# Altium schematic sheet PCB-MAIN_01_POWER.SchDoc
size 594 x 420 mm
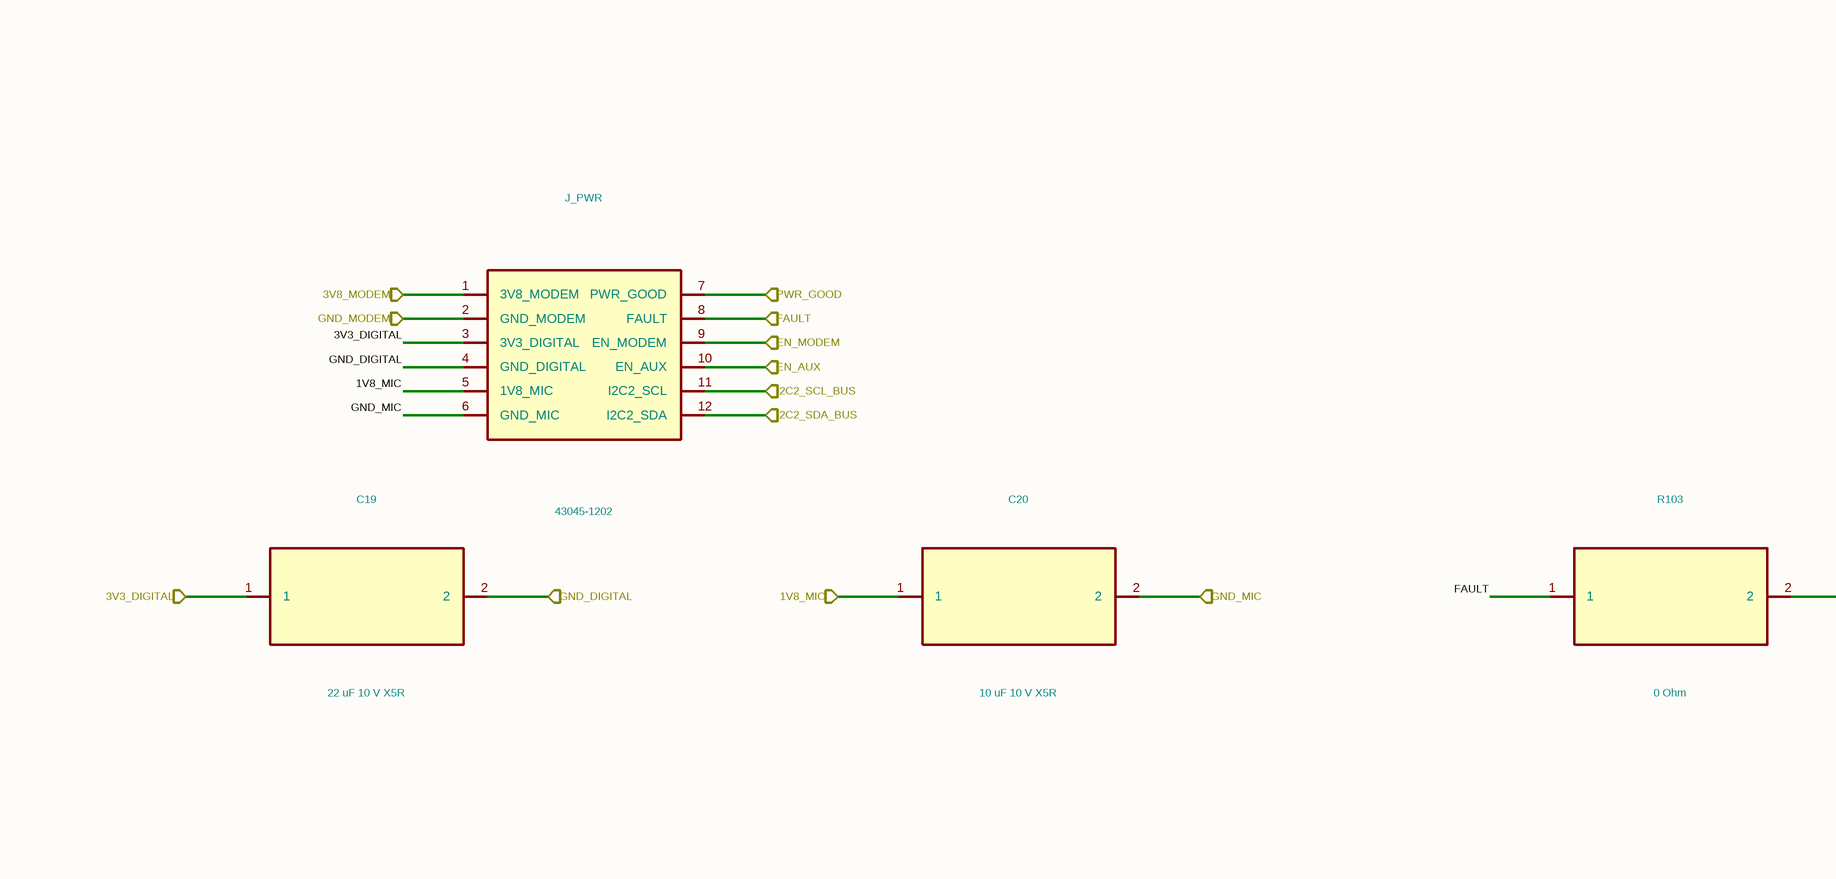
[diagram p0: PCB-MAIN_01_POWER.SchDoc, top left]
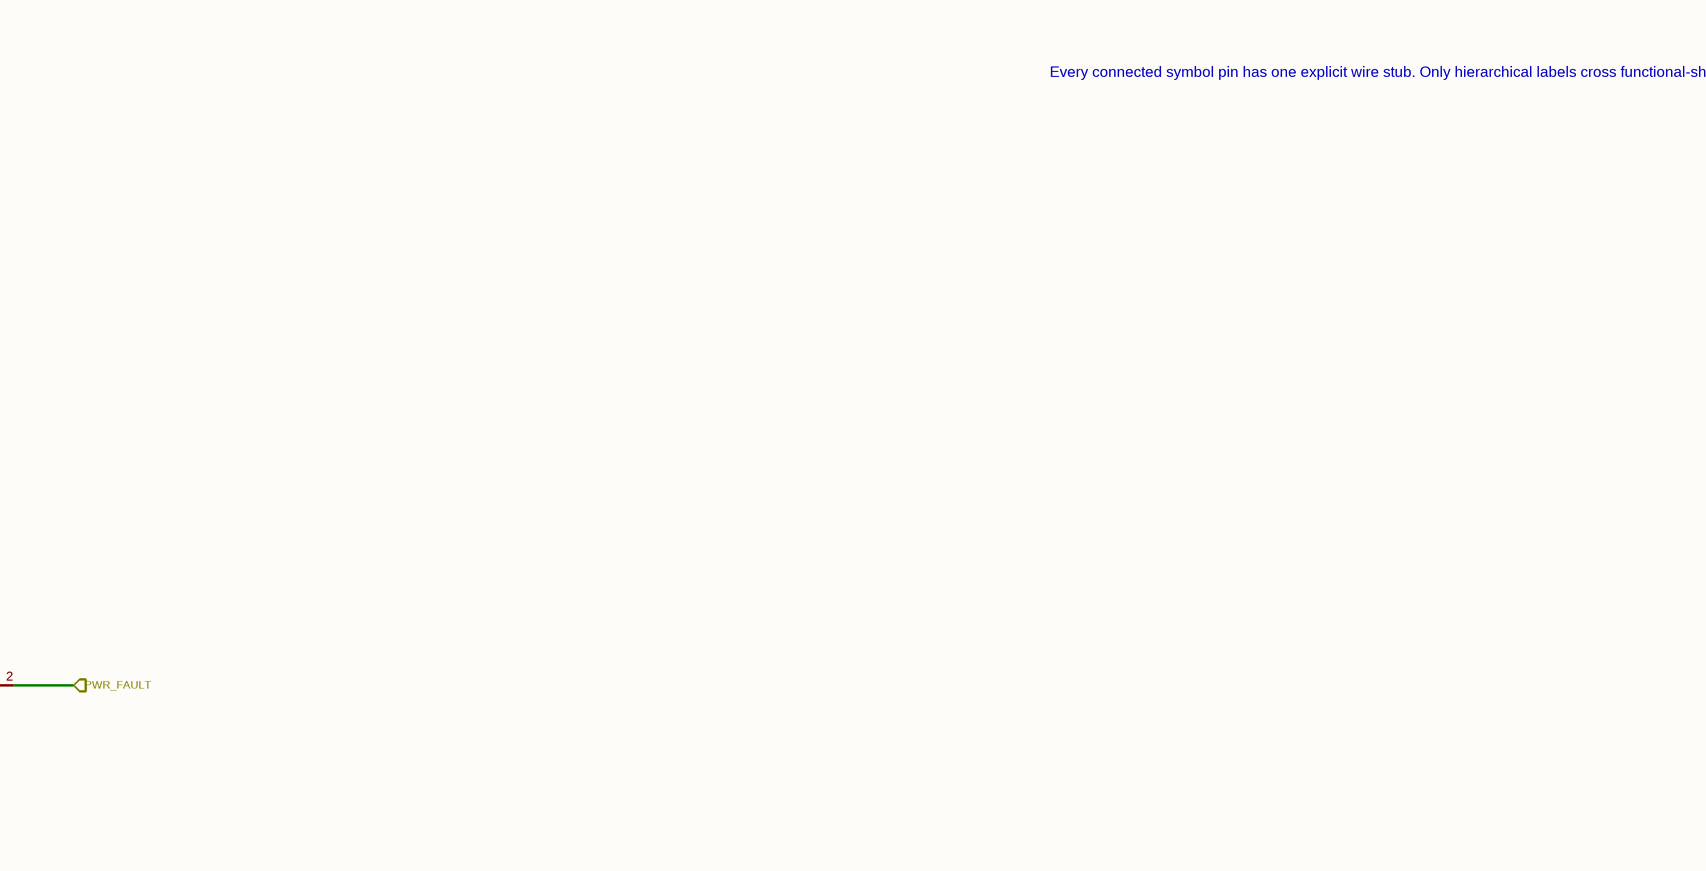
[diagram p1: PCB-MAIN_01_POWER.SchDoc, top right]
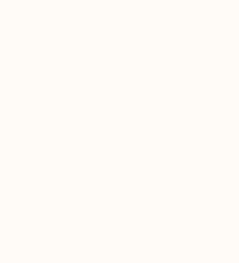
[diagram p2: PCB-MAIN_01_POWER.SchDoc, bottom left]

## Parts
C19  22 uF 10 V X5R  [C_0805_2012Metric]
C20  10 uF 10 V X5R  [C_0603_1608Metric]
J_PWR  43045-1202
R103  0 Ohm  [R_0402_1005Metric]

## Ports
1V8_MIC, 3V3_DIGITAL, 3V8_MODEM, EN_AUX, EN_MODEM, FAULT, GND_DIGITAL, GND_MIC, GND_MODEM, I2C2_SCL_BUS, I2C2_SDA_BUS, PWR_FAULT, PWR_GOOD

## Nets
1V8_MIC: C20.1 ; port 1V8_MIC
1V8_MIC: J_PWR.5(1V8_MIC)  [a separate net that carries the same name]
3V3_DIGITAL: C19.1 ; port 3V3_DIGITAL
3V3_DIGITAL: J_PWR.3(3V3_DIGITAL)  [a separate net that carries the same name]
3V8_MODEM: J_PWR.1(3V8_MODEM) ; port 3V8_MODEM
EN_AUX: J_PWR.10(EN_AUX) ; port EN_AUX
EN_MODEM: J_PWR.9(EN_MODEM) ; port EN_MODEM
FAULT: J_PWR.8(FAULT) ; port FAULT
FAULT: R103.1  [a separate net that carries the same name]
GND_DIGITAL: C19.2 ; port GND_DIGITAL
GND_DIGITAL: J_PWR.4(GND_DIGITAL)  [a separate net that carries the same name]
GND_MIC: C20.2 ; port GND_MIC
GND_MIC: J_PWR.6(GND_MIC)  [a separate net that carries the same name]
GND_MODEM: J_PWR.2(GND_MODEM) ; port GND_MODEM
I2C2_SCL_BUS: J_PWR.11(I2C2_SCL) ; port I2C2_SCL_BUS
I2C2_SDA_BUS: J_PWR.12(I2C2_SDA) ; port I2C2_SDA_BUS
PWR_FAULT: R103.2 ; port PWR_FAULT
PWR_GOOD: J_PWR.7(PWR_GOOD) ; port PWR_GOOD

## Notes on the sheet
- Every connected symbol pin has one explicit wire stub. Only hierarchical labels cross functional-sheet boundaries.
- 1
- 2
- 3
- 4
- 5
- 6
- 7
- 8
- 9
- 10
- 11
- A
- B
- C
- D
- E
- F
- G
- H
- Human-readable hierarchy candidate; exact Review-A pin/net equivalence enforced
- Functional sheet 2 of 10
- NOT FOR MANUFACTURE - hierarchy review/routing/DRC/DFM/Review B pending
- Title: Dioneya PCB-MAIN Rev.A - Power
- File: PCB-MAIN_01_POWER.kicad_sch
- Sheet: /
- Dioneya / ZS-BPLA
- KiCad E.D.A.  kicad (5.1.4)-1
- Size: A2
- Date: 2026-09-16
- Rev: A
- Id: 1/1

## Library data of the parts
C19 = C19_GRM21BR61A226ME44L: Manufacturer: Murata; Population: FITTED; Authority: PROJECT_MAIN_AUTH_010; MPN: GRM21BR61A226ME44L; Package: 0805; Value: 22 uF 10 V X5R; Footprint: Capacitor_SMD:C_0805_2012Metric
C20 = C20_GRM188R61A106KE69D: Manufacturer: Murata; Population: FITTED; Authority: PROJECT_MAIN_AUTH_010; MPN: GRM188R61A106KE69D; Package: 0603; Value: 10 uF 10 V X5R; Footprint: Capacitor_SMD:C_0603_1608Metric
J_PWR = J_PWR_43045-1202: Manufacturer: Molex; Population: FITTED; Authority: HARNESS_LOGICAL_PINOUT_REV_A.csv; MPN: 43045-1202; Package: Micro-Fit_3.0_2x06_Right_Angle; Value: 43045-1202
R103 = R103_ERJ-2GE0R00X: Manufacturer: Panasonic; Population: FITTED; Authority: PROJECT_MAIN_AUTH_010; MPN: ERJ-2GE0R00X; Package: 0402; Value: 0 Ohm; Footprint: Resistor_SMD:R_0402_1005Metric